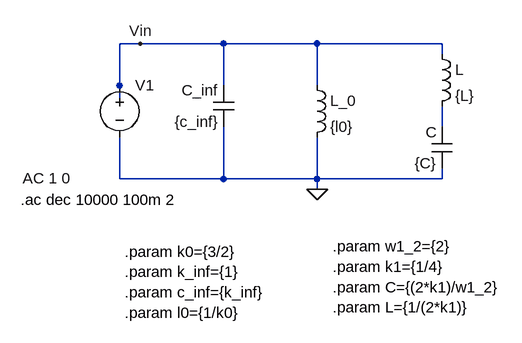
[diagram p0: schematic foster_derivacion.asc]
foster_derivacion.asc, the LTspice schematic file:
Version 4.1
SHEET 1 880 680
WIRE -16 64 -48 64
WIRE 112 64 -16 64
WIRE 256 64 112 64
WIRE 448 64 256 64
WIRE 448 80 448 64
WIRE -48 128 -48 64
WIRE 112 128 112 64
WIRE 256 128 256 64
WIRE -48 160 -48 128
WIRE 448 192 448 160
WIRE -48 272 -48 208
WIRE 112 272 112 192
WIRE 112 272 -48 272
WIRE 256 272 256 208
WIRE 256 272 112 272
WIRE 448 272 448 256
WIRE 448 272 256 272
WIRE 256 288 256 272
FLAG -16 64 Vin
FLAG 256 288 0
SYMBOL cap 128 192 R180
WINDOW 0 24 56 Left 2
WINDOW 3 24 8 Left 2
SYMATTR InstName C_inf
SYMATTR Value {c_inf}
SYMBOL ind 240 112 R0
SYMATTR InstName L_0
SYMATTR Value {l0}
SYMATTR SpiceLine Rser=1m
SYMBOL ind 432 64 R0
SYMATTR InstName L
SYMATTR Value {L}
SYMATTR SpiceLine Rser=1m
SYMBOL cap 464 256 R180
WINDOW 0 24 56 Left 2
WINDOW 3 24 8 Left 2
SYMATTR InstName C
SYMATTR Value {C}
SYMBOL voltage -48 112 R0
WINDOW 123 -149 159 Left 2
WINDOW 39 0 0 Left 0
SYMATTR InstName V1
SYMATTR Value ""
SYMATTR Value2 AC 1 0
TEXT -200 304 Left 2 !.ac dec 10000 100m 2
TEXT -40 384 Left 2 !.param k0={3/2}\n.param k_inf={1}\n.param c_inf={k_inf}\n.param l0={1/k0}
TEXT 280 376 Left 2 !.param w1_2={2}\n.param k1={1/4}\n.param C={(2*k1)/w1_2}\n.param L={1/(2*k1)}

The netlist it stands for:
* foster_derivacion.asc
C_inf 0 Vin {c_inf}
L_0 Vin 0 {l0} Rser=1m
L Vin N001 {L} Rser=1m
C 0 N001 {C}
V1 Vin 0 AC 1 0
.ac dec 10000 100m 2
.param k0={3/2}
.param k_inf={1}
.param c_inf={k_inf}
.param l0={1/k0}
.param w1_2={2}
.param k1={1/4}
.param C={(2*k1)/w1_2}
.param L={1/(2*k1)}
.backanno
.end